# Altium schematic sheet analog_assembly.SchDoc: Analog system assembly
size A4; DocumentNumber: ADC-SCH-02; SheetNumber: 2; SheetTotal: 20
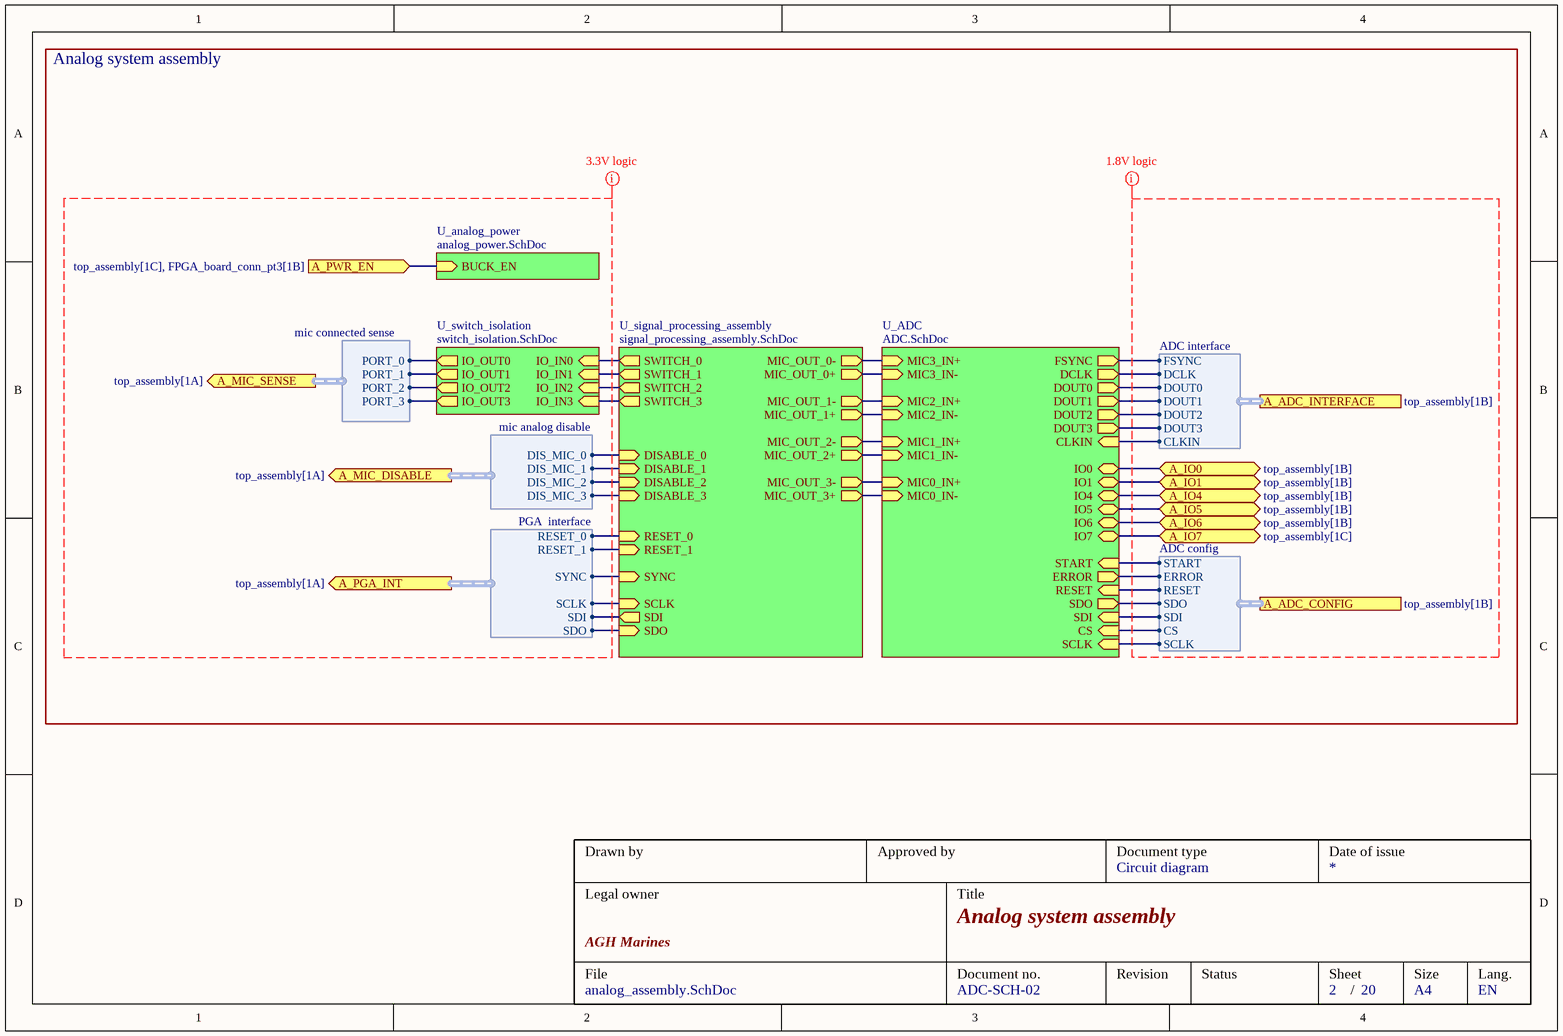
[diagram p0: analog_assembly.SchDoc]

## Sub-sheets
U_ADC = ADC.SchDoc: MIC0_IN+ (in), MIC0_IN- (in), MIC1_IN+ (in), MIC1_IN- (in), MIC2_IN+ (in), MIC2_IN- (in), MIC3_IN+ (in), MIC3_IN- (in), IO6 (bidir), IO7 (bidir), IO5 (bidir), IO1 (bidir), IO4 (bidir), CLKIN (in), FSYNC (out), DCLK (out), DOUT0 (out), DOUT2 (out), DOUT1 (out), DOUT3 (out), ERROR (out), START (in), RESET (in), SDI (in), SDO (out), CS (in), SCLK (in), IO0 (bidir)
U_analog_power = analog_power.SchDoc: BUCK_EN (in)
U_signal_processing_assembly = signal_processing_assembly.SchDoc: MIC_OUT_0- (out), MIC_OUT_0+ (out), MIC_OUT_1- (out), MIC_OUT_1+ (out), MIC_OUT_2- (out), MIC_OUT_2+ (out), MIC_OUT_3- (out), MIC_OUT_3+ (out), DISABLE_0 (in), DISABLE_1 (in), DISABLE_2 (in), DISABLE_3 (in), RESET_0 (in), RESET_1 (in), SYNC (in), SWITCH_0 (out), SWITCH_1 (out), SWITCH_2 (out), SWITCH_3 (out), SCLK (in), SDI (out), SDO (in)
U_switch_isolation = switch_isolation.SchDoc: IO_IN0 (in), IO_IN1 (in), IO_IN2 (in), IO_IN3 (in), IO_OUT0 (out), IO_OUT1 (out), IO_OUT2 (out), IO_OUT3 (out)

## Ports
A_ADC_CONFIG (harness ADC config, see top_assembly[1B]), A_ADC_INTERFACE (harness ADC interface, see top_assembly[1B]), A_IO0 (bidir, see top_assembly[1B]), A_IO1 (bidir, see top_assembly[1B]), A_IO4 (bidir, see top_assembly[1B]), A_IO5 (bidir, see top_assembly[1B]), A_IO6 (bidir, see top_assembly[1B]), A_IO7 (bidir, see top_assembly[1C]), A_MIC_DISABLE (out, harness mic analog disable, see top_assembly[1A]), A_MIC_SENSE (out, harness mic connected sense, see top_assembly[1A]), A_PGA_INT (out, harness PGA  interface, see top_assembly[1A]), A_PWR_EN (in, see top_assembly[1C], FPGA_board_conn_pt3[1B])

## Harnesses
mic connected sense: PORT_0, PORT_1, PORT_2, PORT_3
mic analog disable: DIS_MIC_0, DIS_MIC_1, DIS_MIC_2, DIS_MIC_3
PGA  interface: RESET_0, RESET_1, SYNC, SCLK, SDI, SDO
ADC interface: FSYNC, DCLK, DOUT0, DOUT1, DOUT2, DOUT3, CLKIN
ADC config: START, ERROR, RESET, SDO, SDI, CS, SCLK

## Nets
A_IO0: port A_IO0, sheet U_ADC/IO0
A_IO1: port A_IO1, sheet U_ADC/IO1
A_IO4: port A_IO4, sheet U_ADC/IO4
A_IO5: port A_IO5, sheet U_ADC/IO5
A_IO6: port A_IO6, sheet U_ADC/IO6
A_IO7: port A_IO7, sheet U_ADC/IO7
A_PWR_EN: port A_PWR_EN, sheet U_analog_power/BUCK_EN
(unnamed): sheet U_signal_processing_assembly/MIC_OUT_0-, sheet U_ADC/MIC3_IN+
(unnamed): sheet U_signal_processing_assembly/MIC_OUT_0+, sheet U_ADC/MIC3_IN-
(unnamed): sheet U_signal_processing_assembly/MIC_OUT_1-, sheet U_ADC/MIC2_IN+
(unnamed): sheet U_signal_processing_assembly/MIC_OUT_1+, sheet U_ADC/MIC2_IN-
(unnamed): sheet U_signal_processing_assembly/MIC_OUT_2-, sheet U_ADC/MIC1_IN+
(unnamed): sheet U_signal_processing_assembly/MIC_OUT_2+, sheet U_ADC/MIC1_IN-
(unnamed): sheet U_signal_processing_assembly/MIC_OUT_3-, sheet U_ADC/MIC0_IN+
(unnamed): sheet U_signal_processing_assembly/MIC_OUT_3+, sheet U_ADC/MIC0_IN-
(unnamed): sheet U_signal_processing_assembly/DISABLE_0, port A_MIC_DISABLE.DIS_MIC_0
(unnamed): sheet U_signal_processing_assembly/DISABLE_1, port A_MIC_DISABLE.DIS_MIC_1
(unnamed): sheet U_signal_processing_assembly/DISABLE_2, port A_MIC_DISABLE.DIS_MIC_2
(unnamed): sheet U_signal_processing_assembly/DISABLE_3, port A_MIC_DISABLE.DIS_MIC_3
(unnamed): sheet U_signal_processing_assembly/RESET_0, port A_PGA_INT.RESET_0
(unnamed): sheet U_signal_processing_assembly/RESET_1, port A_PGA_INT.RESET_1
(unnamed): sheet U_signal_processing_assembly/SYNC, port A_PGA_INT.SYNC
(unnamed): sheet U_signal_processing_assembly/SWITCH_0, sheet U_switch_isolation/IO_IN0
(unnamed): sheet U_signal_processing_assembly/SWITCH_1, sheet U_switch_isolation/IO_IN1
(unnamed): sheet U_signal_processing_assembly/SWITCH_2, sheet U_switch_isolation/IO_IN2
(unnamed): sheet U_signal_processing_assembly/SWITCH_3, sheet U_switch_isolation/IO_IN3
(unnamed): sheet U_signal_processing_assembly/SCLK, port A_PGA_INT.SCLK
(unnamed): sheet U_signal_processing_assembly/SDI, port A_PGA_INT.SDI
(unnamed): sheet U_signal_processing_assembly/SDO, port A_PGA_INT.SDO
(unnamed): sheet U_ADC/CLKIN, port A_ADC_INTERFACE.CLKIN
(unnamed): sheet U_ADC/FSYNC, port A_ADC_INTERFACE.FSYNC
(unnamed): sheet U_ADC/DCLK, port A_ADC_INTERFACE.DCLK
(unnamed): sheet U_ADC/DOUT0, port A_ADC_INTERFACE.DOUT0
(unnamed): sheet U_ADC/DOUT2, port A_ADC_INTERFACE.DOUT2
(unnamed): sheet U_ADC/DOUT1, port A_ADC_INTERFACE.DOUT1
(unnamed): sheet U_ADC/DOUT3, port A_ADC_INTERFACE.DOUT3
(unnamed): sheet U_ADC/ERROR, port A_ADC_CONFIG.ERROR
(unnamed): sheet U_ADC/START, port A_ADC_CONFIG.START
(unnamed): sheet U_ADC/RESET, port A_ADC_CONFIG.RESET
(unnamed): sheet U_ADC/SDI, port A_ADC_CONFIG.SDI
(unnamed): sheet U_ADC/SDO, port A_ADC_CONFIG.SDO
(unnamed): sheet U_ADC/CS, port A_ADC_CONFIG.CS
(unnamed): sheet U_ADC/SCLK, port A_ADC_CONFIG.SCLK
(unnamed): sheet U_switch_isolation/IO_OUT0, port A_MIC_SENSE.PORT_0
(unnamed): sheet U_switch_isolation/IO_OUT1, port A_MIC_SENSE.PORT_1
(unnamed): sheet U_switch_isolation/IO_OUT2, port A_MIC_SENSE.PORT_2
(unnamed): sheet U_switch_isolation/IO_OUT3, port A_MIC_SENSE.PORT_3

## Layout directives
mark named 3.3V logic: (no net found under the mark)
mark named 1.8V logic: (no net found under the mark)

## Notes on the sheet
- Analog system assembly
- Drawn by
- Approved by
- Document type
- Date of issue
- Legal owner
- Title
- Circuit diagram
- File
- AGH Marines
- Document no.
- Revision
- Status
- Sheet
- Size
- Lang.
- /
- A4
- EN